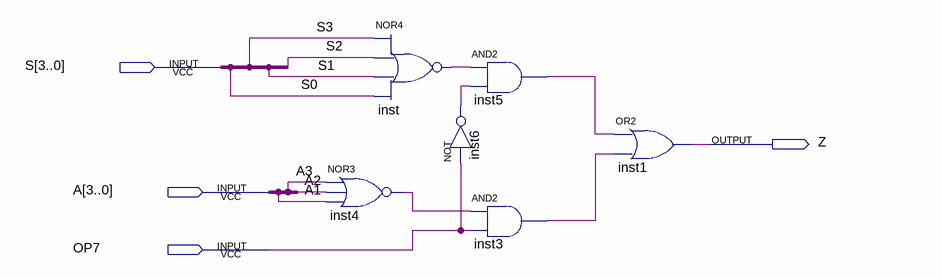
[diagram p0: schematic sheet]
// Quartus schematic Z-flag-logic.bdf as structural Verilog: 6 symbols, 4 pins
module \Z-flag-logic  (
  input  [3:0] S,
  input  [3:0] A,
  input  OP7,
  output Z
);

  wire inst3_out, inst4_out, inst5_out, inst6_out, inst_out;

  nor inst4 (inst4_out, A[3], A[2], A[1]);
  nor inst (inst_out, S[3], S[2], S[1], S[0]);
  and inst5 (inst5_out, inst_out, inst6_out);
  not inst6 (inst6_out, OP7);
  and inst3 (inst3_out, inst4_out, OP7);
  or inst1 (Z, inst5_out, inst3_out);
endmodule
